# Altium schematic sheet RK3566_AUDIO_SHEET.SchDoc
size A4; SheetNumber: 17; SheetTotal: 23
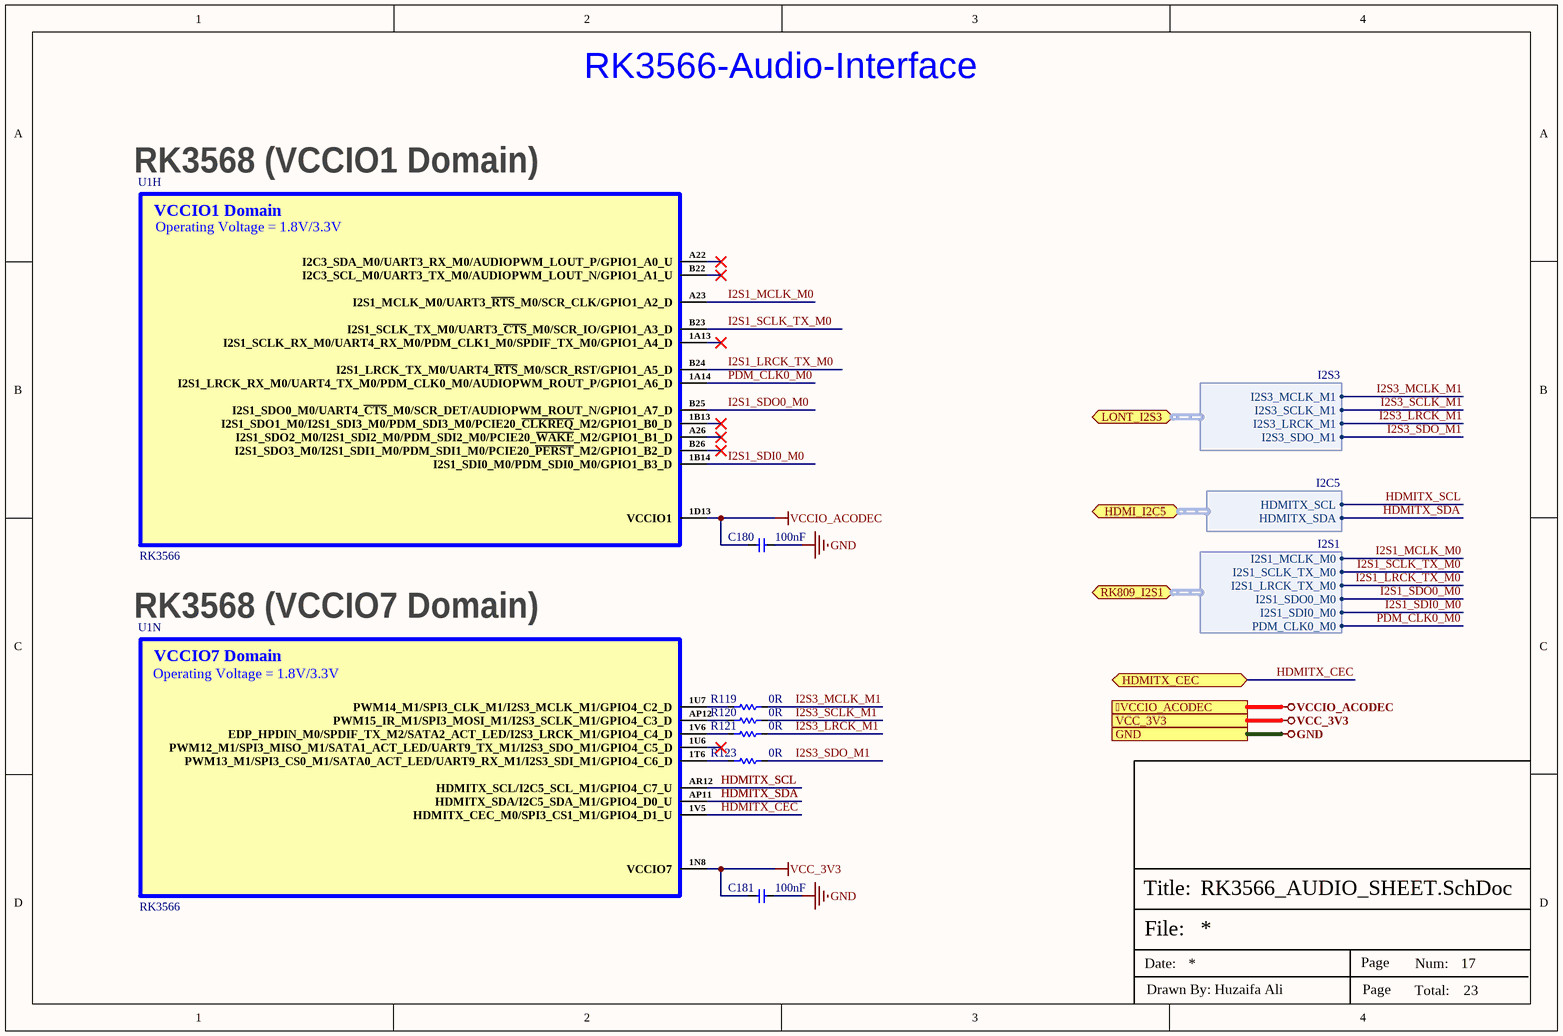
[diagram p0: RK3566_AUDIO_SHEET.SchDoc]

## Parts
C180  100nF  [CAP-0201]
C181  100nF  [CAP-0201]
R119  0R  [Res-0201]
R120  0R  [Res-0201]
R121  0R  [Res-0201]
R123  0R  [Res-0201]
U1  RK3566  [BGA-565(15.5x14.4)]  (parts H,N of 22)

## Ports
VCCIO_ACODEC, GND (see DRAM_LPDDR4_SHEET[6D], eMMC_SPI-FLASH_SHEET[1D], HDMI2.0_SHEET[3D], POWER_LDO_SHEET[3D], POWER_OTHER_SHEET[3C], POWER_PMIC_RK809_CODEC[3C], POWER_PMIC_RK809_DC DC[3D], POWER_PMIC_RK809_LDO[4C], POWER_PMIC_RK809_MGM[3D], RK3566_DDR-PHY_SHEET[5D], RK3566_FLASH-SD_SHEET[4C], RK3566_OSC_PMUIO_SHEET[5D], RK3566_POWER_SHEET[3D], RK3566_SARADC_GPIO[3D], RK3566_USB_PCIe_SHEET[3D], RK3566_VI_SHEET[3D], RK3566_VO_SHEET_1[3C], RK3566_VO_SHEET_2[4C], TYPE-C_INTERFACE_SHEET[3D], TYPE-C_TO_MIPI-CSI_SHEET[5D], USB2.0_SHEET[3D], WIFI-6_SHEET[3D]), HDMI_I2C5 (bidir, harness I2C5, see HDMI2.0_SHEET[2D]), HDMITX_CEC (bidir, see HDMI2.0_SHEET[3D]), LONT_I2S3 (bidir, harness I2S3, see TYPE-C_TO_MIPI-CSI_SHEET[4D]), RK809_I2S1 (bidir, harness I2S1, see POWER_PMIC_RK809_CODEC[3C]), VCC_3V3 (see eMMC_SPI-FLASH_SHEET[1D], HDMI2.0_SHEET[3D], POWER_PMIC_RK809_LDO[4C], RK3566_SARADC_GPIO[3D], RK3566_USB_PCIe_SHEET[3D], RK3566_VI_SHEET[3D], RK3566_VO_SHEET_2[4C], TYPE-C_TO_MIPI-CSI_SHEET[5D], WIFI-6_SHEET[3D])

## Harnesses
I2C5: HDMITX_SCL, HDMITX_SDA
I2S1: I2S1_MCLK_M0, I2S1_SCLK_TX_M0, I2S1_LRCK_TX_M0, I2S1_SDO0_M0, I2S1_SDI0_M0, PDM_CLK0_M0
I2S3: I2S3_MCLK_M1, I2S3_SCLK_M1, I2S3_LRCK_M1, I2S3_SDO_M1

## Nets
GND: C180.1 C181.1 ; port GND
VCC_3V3: C181.2 U1.1N8(VCCIO7) ; port VCC_3V3
VCCIO_ACODEC: C180.2 U1.1D13(VCCIO1) ; port VCCIO_ACODEC
HDMITX_CEC: U1.1V5(HDMITX_CEC_M0/SPI3_CS1_M1/GPIO4_D1_U) ; port HDMITX_CEC
HDMITX_SCL: U1.AR12(HDMITX_SCL/I2C5_SCL_M1/GPIO4_C7_U) ; port HDMI_I2C5.HDMITX_SCL
HDMITX_SDA: U1.AP11(HDMITX_SDA/I2C5_SDA_M1/GPIO4_D0_U) ; port HDMI_I2C5.HDMITX_SDA
I2S1_LRCK_TX_M0: U1.B24(I2S1_LRCK_TX_M0/UART4_~{RTS}_M0/SCR_RST/GPIO1_A5_D) ; port RK809_I2S1.I2S1_LRCK_TX_M0
I2S1_MCLK_M0: U1.A23(I2S1_MCLK_M0/UART3_~{RTS}_M0/SCR_CLK/GPIO1_A2_D) ; port RK809_I2S1.I2S1_MCLK_M0
I2S1_SCLK_TX_M0: U1.B23(I2S1_SCLK_TX_M0/UART3_~{CTS}_M0/SCR_IO/GPIO1_A3_D) ; port RK809_I2S1.I2S1_SCLK_TX_M0
I2S1_SDI0_M0: U1.1B14(I2S1_SDI0_M0/PDM_SDI0_M0/GPIO1_B3_D) ; port RK809_I2S1.I2S1_SDI0_M0
I2S1_SDO0_M0: U1.B25(I2S1_SDO0_M0/UART4_~{CTS}_M0/SCR_DET/AUDIOPWM_ROUT_N/GPIO1_A7_D) ; port RK809_I2S1.I2S1_SDO0_M0
I2S3_LRCK_M1: R121.2 ; port LONT_I2S3.I2S3_LRCK_M1
I2S3_MCLK_M1: R119.2 ; port LONT_I2S3.I2S3_MCLK_M1
I2S3_SCLK_M1: R120.2 ; port LONT_I2S3.I2S3_SCLK_M1
I2S3_SDO_M1: R123.2 ; port LONT_I2S3.I2S3_SDO_M1
PDM_CLK0_M0: U1.1A14(I2S1_LRCK_RX_M0/UART4_TX_M0/PDM_CLK0_M0/AUDIOPWM_ROUT_P/GPIO1_A6_D) ; port RK809_I2S1.PDM_CLK0_M0
NetR119_1: R119.1 U1.1U7(PWM14_M1/SPI3_CLK_M1/I2S3_MCLK_M1/GPIO4_C2_D)
NetR120_1: R120.1 U1.AP12(PWM15_IR_M1/SPI3_MOSI_M1/I2S3_SCLK_M1/GPIO4_C3_D)
NetR121_1: R121.1 U1.1V6(EDP_HPDIN_M0/SPDIF_TX_M2/SATA2_ACT_LED/I2S3_LRCK_M1/GPIO4_C4_D)
NetR123_1: R123.1 U1.1T6(PWM13_M1/SPI3_CS0_M1/SATA0_ACT_LED/UART9_RX_M1/I2S3_SDI_M1/GPIO4_C6_D)

Not connected (* = marked no-connect by the designer): U1 1A13(I2S1_SCLK_RX_M0/UART4_RX_M0/PDM_CLK1_M0/SPDIF_TX_M0/GPIO1_A4_D)* 1B13(I2S1_SDO1_M0/I2S1_SDI3_M0/PDM_SDI3_M0/PCIE20_~{CLKREQ}_M2/GPIO1_B0_D)* 1U6(PWM12_M1/SPI3_MISO_M1/SATA1_ACT_LED/UART9_TX_M1/I2S3_SDO_M1/GPIO4_C5_D)* A22(I2C3_SDA_M0/UART3_RX_M0/AUDIOPWM_LOUT_P/GPIO1_A0_U)* A26(I2S1_SDO2_M0/I2S1_SDI2_M0/PDM_SDI2_M0/PCIE20_~{WAKE}_M2/GPIO1_B1_D)* B22(I2C3_SCL_M0/UART3_TX_M0/AUDIOPWM_LOUT_N/GPIO1_A1_U)* B26(I2S1_SDO3_M0/I2S1_SDI1_M0/PDM_SDI1_M0/PCIE20_~{PERST}_M2/GPIO1_B2_D)*

## Notes on the sheet
- RK3566-Audio-Interface
- RK3568 (VCCIO1 Domain)
- RK3568 (VCCIO7 Domain)
- File:
- Title:
- Date:
- Page
- Num:
- Total:
- Drawn By: Huzaifa Ali
- (in symbol RK3566, part H) VCCIO1 Domain; Operating Voltage = 1.8V/3.3V
- (in symbol RK3566, part N) VCCIO7 Domain; Operating Voltage = 1.8V/3.3V

## Library data of the parts
C180 C181 = CC0201KRX5R6BB104: CAP CER 0.1UF 10V X5R 0201; Manufacturer: Yageo; Tolerance: 10%; Supplier 1: Mouser; Manufacturer Part Number: CC0201KRX5R6BB104; RoHS: Yes; Category: Ceramic Capacitors; Stock 1: 824403; Pricing 1: 1=0.10000, 10=0.02400, 50=0.02400, 100=0.01900, 1000=0.01100, 10000=0.00900 (USD); Mount: Surface Mount; Case/Package: 0201; Case Code (Imperial): 0201; Case Code (Metric): 0603; Weight: 6E-06oz; Min Operating Temperature: -55°C; Max Operating Temperature: 85°C; Capacitance: 100nF; Dielectric: X5R; Voltage Rating (DC): 10V; Packaging: Tape and Reel; Termination: SMD/SMT; Resistor Type: Ceramic; Voltage Rating: 10V; Series: CC; Construction: Flat; Length: 0.6mm; Width: 0.012inch; Height: 0.3mm; Thickness: 0.013inch; Depth: 0.3mm; Radiation Hardening: No; Lead Free: Lead Free; Halogen Free: Halogen Free; RoHS Compliant: Yes; ComponentLink1URL: https://datasheet.ciiva.com/11587/upy-gphc-x5r-4v-to-50v-12-11587190.pdf?src-supplier=Avnet; ComponentLink1Description: https://datasheet.ciiva.com/11587/upy-gphc-x5r-4v-to-50v-12-11587190.pdf?src-supplier=Avnet; Supplier Part Number 1: 603-CC201KRX5R6BB104; LCSC Part Number: C190183
R119-R121 R123 = RC0201JR-070RL: RES SMD 0 OHM JUMPER 1/20W 0201; Manufacturer: Yageo; Tolerance: 5%; Power Rating: 50mW; Voltage Rating: 25V; Supplier 1: Digi-Key; Manufacturer Part Number: RC0201JR-070RL; RoHS: Yes; Stock 1: 11079; Pricing 1: 1=0.10000, 10=0.03600, 25=0.02640, 50=0.02000, 100=0.01480, 250=0.01128, 500=0.00904, 1000=0.00665, 5000=0.00477 (USD); Case/Package: 0201; Contact Plating: Tin,Matte; Case Code (Imperial): 0201; Case Code (Metric): 0603; Size Code: 0201; Min Operating Temperature: -55°C; Max Operating Temperature: 125°C; Resistance: 0R; Resistor Type: Thick Film; Packaging: Tape and Reel; Termination: SMD/SMT; Features: Moisture Resistant; Series: RC; Max Power Dissipation: 50mW; Number of Terminations: 2; Length: 0.6mm; Width: 0.012inch; Height: 0.01inch; Radiation Hardening: No; Lead Free: Lead Free; RoHS Compliant: Yes; ComponentLink1URL: https://datasheet.ciiva.com/7672/1563626-7672247.pdf?src-supplier=Element14; ComponentLink1Description: https://datasheet.ciiva.com/7672/1563626-7672247.pdf?src-supplier=Element14; ComponentLink2URL: https://datasheet.ciiva.com/7660/1421516-7660808.pdf?src-supplier=Element14; ComponentLink2Description: https://datasheet.ciiva.com/7660/1421516-7660808.pdf?src-supplier=Element14; Supplier Part Number 1: 311-0.0NCT-ND; LCSC Part Number: C106228; Category: Chip SMD Resistors; Weight: 6E-06oz; Package Quantity: 10000; Voltage Rating (DC): 25V; Construction: Rectangular; Resistance Tolerance: 5%; Depth: 0.3mm; REACH SVHC: Unknown; Military Standard: Not; ComponentLink3URL: https://datasheet.ciiva.com/7672/1563626-7672248.pdf?src-supplier=Element14; ComponentLink3Description: https://datasheet.ciiva.com/7672/1563626-7672248.pdf?src-supplier=Element14; ComponentLink4URL: https://datasheet.ciiva.com/16855/pyu-rc0201-51-rohs-l-8-16855994.pdf?src-supplier=Avnet+Europe; ComponentLink4Description: https://datasheet.ciiva.com/16855/pyu-rc0201-51-rohs-l-8-16855994.pdf?src-supplier=Avnet+Europe; ComponentLink5URL: https://datasheet.ciiva.com/28419/pyu-rc0201-51-rohs-l-8-28419660.pdf?src-supplier=Avnet+Europe; ComponentLink5Description: https://datasheet.ciiva.com/28419/pyu-rc0201-51-rohs-l-8-28419660.pdf?src-supplier=Avnet+Europe; ComponentLink6URL: https://datasheet.ciiva.com/46391/1421516-46391340.pdf?src-supplier=Element14; ComponentLink6Description: https://datasheet.ciiva.com/46391/1421516-46391340.pdf?src-supplier=Element14; ComponentLink7URL: https://datasheet.ciiva.com/8896/pyu-rc0201-51-rohs-l-8-8896143.pdf?src-supplier=Avnet; ComponentLink7Description: https://datasheet.ciiva.com/8896/pyu-rc0201-51-rohs-l-8-8896143.pdf?src-supplier=Avnet
U1 = RK3566: BGA-565(15.5x14.4) Microcontrollers (MCU/MPU/SOC) ROHS; Manufacturer: Rockchip; Item Type: IC; Manufacturer Part Number: RK3566; Package: BGA-565(15.5x14.4); LCSC Part Number: C2943786; ComponentLink1Description: LCSC; ComponentLink1URL: https://www.lcsc.com/product-detail/Microcontrollers-MCU-MPU-SOC_Rockchip-RK3566_C2943786.html